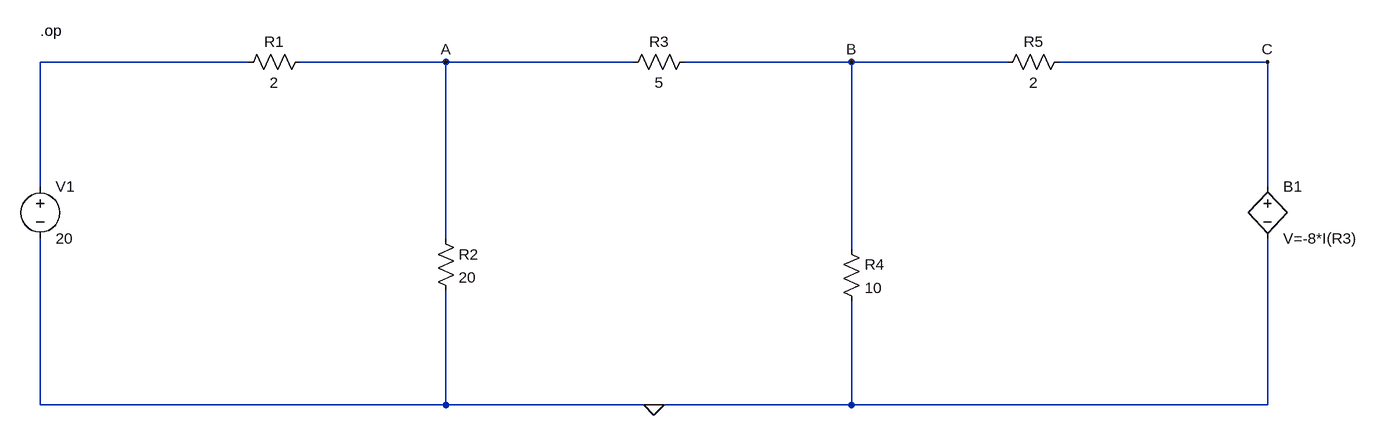
[diagram p0: schematic circuito_fase1.asc]
circuito_fase1.asc, the LTspice schematic file:
Version 4.1
SHEET 1 1732 692
WIRE 0 48 -320 48
WIRE 304 48 80 48
WIRE 592 48 304 48
WIRE 928 48 672 48
WIRE 1168 48 928 48
WIRE 1568 48 1248 48
WIRE -320 240 -320 48
WIRE 1568 240 1568 48
WIRE 304 320 304 48
WIRE 928 336 928 48
WIRE -320 576 -320 320
WIRE 304 576 304 400
WIRE 304 576 -320 576
WIRE 624 576 304 576
WIRE 928 576 928 416
WIRE 928 576 624 576
WIRE 1568 576 1568 320
WIRE 1568 576 928 576
FLAG 624 576 0
FLAG 304 48 A
FLAG 928 48 B
FLAG 1568 48 C
DATAFLAG 144 48 ""
DATAFLAG 752 48 ""
DATAFLAG 1408 48 ""
SYMBOL res 96 32 R90
WINDOW 0 0 56 VBottom 2
WINDOW 3 32 56 VTop 2
SYMATTR InstName R1
SYMATTR Value 2
SYMBOL res 288 304 R0
SYMATTR InstName R2
SYMATTR Value 20
SYMBOL res 688 32 R90
WINDOW 0 0 56 VBottom 2
WINDOW 3 32 56 VTop 2
SYMATTR InstName R3
SYMATTR Value 5
SYMBOL res 912 320 R0
SYMATTR InstName R4
SYMATTR Value 10
SYMBOL res 1264 32 R90
WINDOW 0 0 56 VBottom 2
WINDOW 3 32 56 VTop 2
SYMATTR InstName R5
SYMATTR Value 2
SYMBOL voltage -320 224 R0
SYMATTR InstName V1
SYMATTR Value 20
SYMBOL bv 1568 224 R0
SYMATTR InstName B1
SYMATTR Value V=-8*I(R3)
TEXT -320 0 Left 2 !.op

The netlist it stands for:
* circuito_fase1.asc
R1 A N001 2
R2 A 0 20
R3 B A 5
R4 B 0 10
R5 C B 2
V1 N001 0 20
B1 C 0 V=-8*I(R3)
.op
.backanno
.end